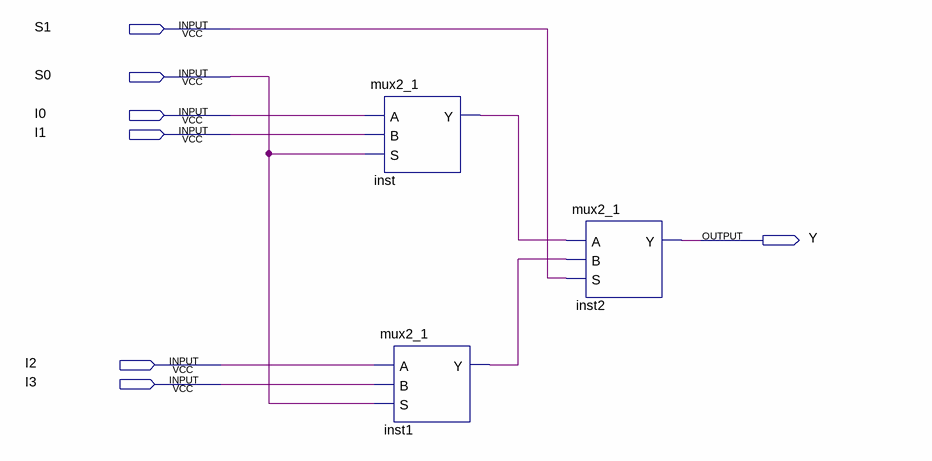
[diagram p0: schematic sheet]
// Quartus schematic mux4_1.bdf as structural Verilog: 3 symbols, 7 pins
module mux4_1 (
  input  S1,
  input  S0,
  input  I0,
  input  I1,
  input  I2,
  input  I3,
  output Y
);

  wire inst1_y, inst_y;

  mux2_1 inst (.A(I0), .B(I1), .S(S0), .Y(inst_y));
  mux2_1 inst1 (.A(I2), .B(I3), .S(S0), .Y(inst1_y));
  mux2_1 inst2 (.A(inst_y), .B(inst1_y), .S(S1), .Y(Y));
endmodule
